# Altium project Ibrahim_Main_Board.PrjPcb (part 2 of 2)

## Sheet MCU_Power_Sheet.SchDoc
size A4; DocumentNumber: 3; SheetNumber: 3; SheetTotal: 7
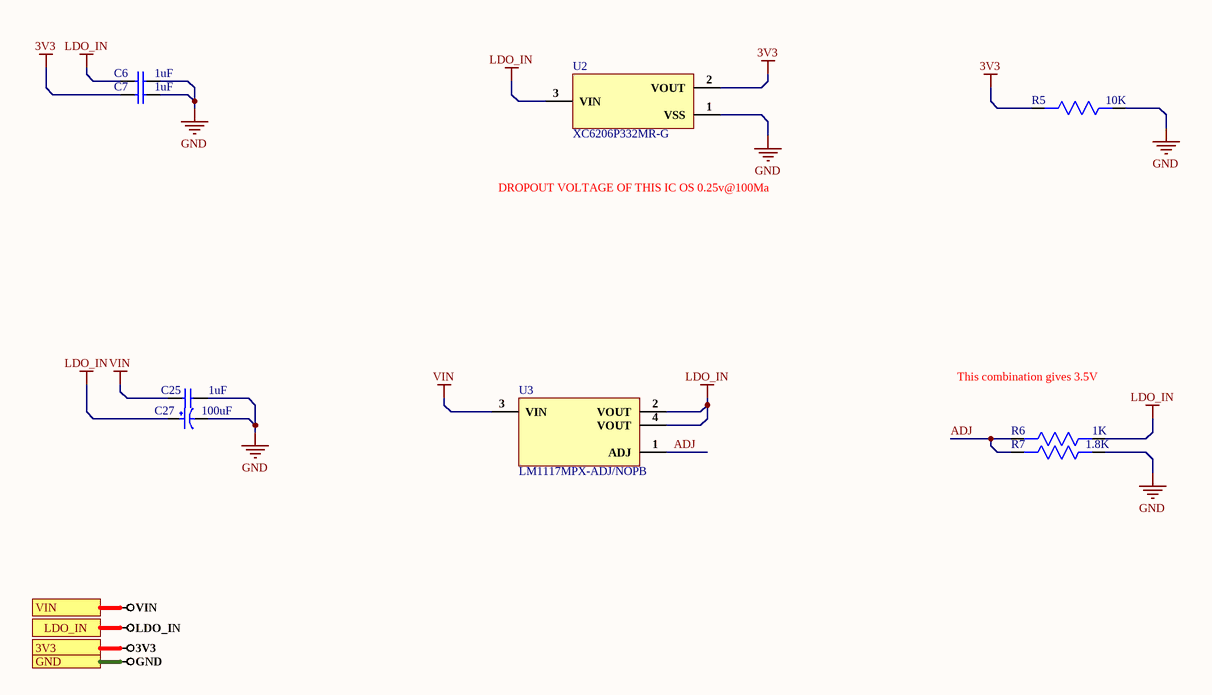
[diagram p5: MCU_Power_Sheet.SchDoc]

### Parts
C6  1uF  [Cap0603]
C7  1uF  [Cap0603]
C25  1uF  [Cap0603]
C27  100uF  [RVT1A101M0505]
R5  10K  [RES 0805]
R6  1K  [RES 0805]
R7  1.8K  [Res0603]
U2  XC6206P332MR-G  [sot-23]
U3  LM1117MPX-ADJ/NOPB  [SOT-223]

### Ports
3V3, GND, LDO_IN, VIN

### Nets
3V3: C7.1 R5.2 U2.2(VOUT) ; port 3V3
GND: C6.2 C7.2 C25.2 C27.2 R5.1 R7.1 U2.1(VSS) ; port GND
LDO_IN: C6.1 C27.1 R6.1 U2.3(VIN) U3.2(VOUT) U3.4(VOUT) ; port LDO_IN
VIN: C25.1 U3.3(VIN) ; port VIN
ADJ: R6.2 R7.2 U3.1(ADJ)

### Notes on the sheet
- DROPOUT VOLTAGE OF THIS IC OS 0.25v@100Ma
- This combination gives 3.5V

### Library data of the parts
C6 C7 C25 = CC0603KRX5R8BB105: CAP CER 1UF 25V X5R 0603; Manufacturer: Yageo; Tolerance: 10%; Supplier 1: Digi-Key; Manufacturer Part Number: CC0603KRX5R8BB105; RoHS: Yes; Category: Ceramic Capacitors; Stock 1: 919939; Pricing 1: 1=0.12000, 10=0.08400, 50=0.04760, 100=0.03940, 500=0.02764, 1000=0.02288 (USD); Mount: Surface Mount; Case/Package: 0603; Number of Pins: 2; Case Code (Metric): 1608; Case Code (Imperial): 0603; Min Operating Temperature: -55°C; Max Operating Temperature: 85°C; Capacitance: 1uF; Dielectric: X5R; Package Quantity: 1; Voltage Rating: 25V; Packaging: Tape and Reel; Termination: SMD/SMT; Voltage Rating (DC): 25V; Series: CC; Construction: Flat; Length: 1.6mm; Width: 0.031inch; Height: 0.8mm; Thickness: 0.035inch; Depth: 0.8mm; Radiation Hardening: No; REACH SVHC: No SVHC; Lead Free: Lead Free; Halogen Free: Halogen Free; RoHS Compliant: Yes; ComponentLink1URL: https://datasheet.ciiva.com/176/mlccorderingcode-176785.pdf?src-supplier=Digi-Key; ComponentLink1Description: https://datasheet.ciiva.com/176/mlccorderingcode-176785.pdf?src-supplier=Digi-Key; ComponentLink2URL: https://datasheet.ciiva.com/176/mlccorderingcode-176786.pdf?src-supplier=Digi-Key; ComponentLink2Description: https://datasheet.ciiva.com/176/mlccorderingcode-176786.pdf?src-supplier=Digi-Key; ComponentLink3URL: https://datasheet.ciiva.com/176/mlccorderingcode-176787.pdf?src-supplier=Digi-Key; ComponentLink3Description: https://datasheet.ciiva.com/176/mlccorderingcode-176787.pdf?src-supplier=Digi-Key; ComponentLink4URL: https://datasheet.ciiva.com/17436/upy-gphc-x5r-4v-to-50v-12-17436952.pdf?src-supplier=Avnet+Europe; ComponentLink4Description: https://datasheet.ciiva.com/17436/upy-gphc-x5r-4v-to-50v-12-17436952.pdf?src-supplier=Avnet+Europe; ComponentLink5URL: https://datasheet.ciiva.com/7978/1525783-7978171.pdf?src-supplier=Element14; ComponentLink5Description: https://datasheet.ciiva.com/7978/1525783-7978171.pdf?src-supplier=Element14; ComponentLink6URL: https://datasheet.ciiva.com/11586/upy-gphc-x5r-4v-to-50v-12-11586318.pdf?src-supplier=Avnet; ComponentLink6Description: https://datasheet.ciiva.com/11586/upy-gphc-x5r-4v-to-50v-12-11586318.pdf?src-supplier=Avnet; Supplier Part Number 1: 311-1445-1-ND
C27 = RVT1A101M0505: 100uF ±20% 10V 5mm 5.4mm 2000hrs 105℃ -45℃~+105℃ SMD,5x5.4mm Aluminum Electrolytic Capacitors - SMD RoHS; Manufacturer: CX(Dongguan Chengxing Elec); Package: SMD,5x5.4mm; Capacitance: 100uF; Tolerance: ±20%; Rated Voltage: 10V; φD: 5mm; L: 5.4mm; Operating Temperature: -45℃~+105℃
R5 = RMCF0805FT10K0: RES 10K OHM 1% 1/8W 0805; Manufacturer: Stackpole Electronics; Resistance: 10kR; Power Rating: 125mW; Temperature Coefficient: 100ppm/°C; Supplier 1: Digi-Key; Manufacturer Part Number: RMCF0805FT10K0; RoHS: Yes; Category: Chip SMD Resistors; Stock 1: 308321; Pricing 1: 1=0.10000, 10=0.02700, 100=0.01090, 1000=0.00488, 2500=0.00423 (USD); Mount: Surface Mount; Case/Package: 0805; Case Code (Metric): 2012; Case Code (Imperial): 0805; Contact Plating: Tin,Matte; Size Code: 0805; Min Operating Temperature: -55°C; Max Operating Temperature: 155°C; Tolerance: 1%; Packaging: Tape and Reel; Resistor Type: Thick Film; Number of Terminations: 2; Max Power Dissipation: 125mW; Features: Automotive AEC-Q200; Series: RMCF; Construction: Rectangular; Length: 2mm; Width: 0.049inch; Height: 0.026inch; Depth: 1.25mm; Radiation Hardening: No; Lead Free: Lead Free; Military Standard: Not; RoHS Compliant: Yes; ComponentLink1URL: https://datasheet.ciiva.com/15193/getdatasheetpartid-362046-15193525.pdf?src-supplier=Verical; ComponentLink1Description: https://datasheet.ciiva.com/15193/getdatasheetpartid-362046-15193525.pdf?src-supplier=Verical; Supplier Part Number 1: RMCF0805FT10K0CT-ND
R6 = CRCW08051K00JNEB: RES SMD 1K OHM 5% 1/8W 0805; Manufacturer: Vishay Dale; Resistance: 1kR; Power Rating: 125mW; Voltage Rating: 150V; Temperature Coefficient: 200ppm/°C; Supplier 1: Digi-Key; Manufacturer Part Number: CRCW08051K00JNEB; RoHS: Yes; Category: Chip SMD Resistors; Stock 1: 4389; Pricing 1: 1=0.10000, 10=0.05000, 100=0.02040, 1000=0.00914, 2500=0.00794, 5000=0.00656 (USD); Case/Package: 0805; Number of Pins: 2; Weight: 0.000194oz; Case Code (Imperial): 0805; Case Code (Metric): 2012; Contact Plating: Tin; Min Operating Temperature: -55°C; Max Operating Temperature: 155°C; Packaging: Tape and Reel; Tolerance: 5%; Package Quantity: 10000; Resistor Type: Thick Film; Number of Terminations: 2; Termination: SMD/SMT; Max Power Dissipation: 125mW; Voltage Rating (DC): 150V; Features: Automotive AEC-Q200; Length: 0.079inch; Width: 0.049inch; Height: 0.02inch; Radiation Hardening: No; REACH SVHC: Unknown; Lead Free: Lead Free; ComponentLink1URL: https://datasheet.ciiva.com/5548/dcrcwe3-109170-5548326.pdf?src-supplier=Mouser; ComponentLink1Description: https://datasheet.ciiva.com/5548/dcrcwe3-109170-5548326.pdf?src-supplier=Mouser; ComponentLink2URL: https://datasheet.ciiva.com/28621/1747939-28621434.pdf?src-supplier=Element14; ComponentLink2Description: https://datasheet.ciiva.com/28621/1747939-28621434.pdf?src-supplier=Element14; Supplier Part Number 1: 541-CRCW08051K00JNEBCT-ND
R7 = RC0603FR-071K8L: Res Thick Film 0603 1.8K Ohm 1% 0.1W(1/10W) ±100ppm/C Molded SMD Paper T/R; Manufacturer: Yageo; Resistance: 1.8kR; Temperature Coefficient: 100ppm/°C; Voltage Rating (DC): 50V; Power Rating: 100mW; Supplier 1: Digi-Key; Manufacturer Part Number: RC0603FR-071K8L; RoHS: Yes; Category: Chip SMD Resistors; Stock 1: 827154; Pricing 1: 1=0.10000, 10=0.02400, 100=0.00970, 1000=0.00436, 2500=0.00378 (USD); Case/Package: 0603; Number of Pins: 2; Case Code (Metric): 1608; Case Code (Imperial): 0603; Size Code: 0603; Min Operating Temperature: -55°C; Max Operating Temperature: 155°C; Tolerance: 1%; Resistor Type: Thick Film; Packaging: Tape and Reel; Voltage Rating: 50V; Package Quantity: 5000; Number of Terminations: 2; Termination: SMD/SMT; Max Power Dissipation: 100mW; Features: Moisture Resistant; Series: RC; Resistance Tolerance: 1%; Technology: THICK FILM; Construction: Rectangular; Length: 1.6mm; Width: 0.8mm; Height: 0.45mm; Depth: 0.8mm; REACH SVHC: No SVHC; Lead Free: Lead Free; Military Standard: Not; RoHS Compliant: Yes; ComponentLink1URL: https://datasheet.ciiva.com/11808/0900766b80f96399-11808105.pdf?src-supplier=RSComponents; ComponentLink1Description: https://datasheet.ciiva.com/11808/0900766b80f96399-11808105.pdf?src-supplier=RSComponents; ComponentLink2URL: https://datasheet.ciiva.com/2519/pyu-r-int-thick-7-2519189.pdf?src-supplier=Digi-Key; ComponentLink2Description: https://datasheet.ciiva.com/2519/pyu-r-int-thick-7-2519189.pdf?src-supplier=Digi-Key; ComponentLink3URL: https://datasheet.ciiva.com/7746/443971-7746277.pdf?src-supplier=Element14; ComponentLink3Description: https://datasheet.ciiva.com/7746/443971-7746277.pdf?src-supplier=Element14; ComponentLink4URL: https://datasheet.ciiva.com/2519/pyu-r-int-thick-7-2519190.pdf?src-supplier=Digi-Key; ComponentLink4Description: https://datasheet.ciiva.com/2519/pyu-r-int-thick-7-2519190.pdf?src-supplier=Digi-Key; ComponentLink5URL: https://datasheet.ciiva.com/7746/443971-7746278.pdf?src-supplier=Element14; ComponentLink5Description: https://datasheet.ciiva.com/7746/443971-7746278.pdf?src-supplier=Element14; ComponentLink6URL: https://datasheet.ciiva.com/12558/rc0603-272842-12558694.pdf?src-supplier=Mouser; ComponentLink6Description: https://datasheet.ciiva.com/12558/rc0603-272842-12558694.pdf?src-supplier=Mouser; ComponentLink7URL: https://datasheet.ciiva.com/2519/pyu-r-int-thick-7-2519191.pdf?src-supplier=Digi-Key; ComponentLink7Description: https://datasheet.ciiva.com/2519/pyu-r-int-thick-7-2519191.pdf?src-supplier=Digi-Key; Supplier Part Number 1: 311-1.80KHRCT-ND
U2 = XC6206P332MR-G: IC REG LINEAR 3.3V 200MA SOT23; Manufacturer: Torex; Output Type: Fixed; Output Configuration: Positive; Number of Regulators: 1; Max Input Voltage: 6V; Dropout Voltage: 680mV; Quiescent Current: 3uA; Supplier 1: Avnet; Manufacturer Part Number: XC6206P332MR-G; RoHS: Yes; Category: Voltage Regulators - Linear; Pricing 1: 3000=0.23146, 6000=0.22820, 12000=0.22168, 18000=0.21679, 24000=0.20864, 30000=0.20375, 300000=0.19886 (USD); Mount: Surface Mount; Case/Package: TO-236-3; Min Operating Temperature: -40°C; Max Operating Temperature: 85°C; Min Output Voltage: 3.3V; Output Current: 200mA; Max Supply Current: 3uA; RoHS Compliant: Yes; ComponentLink1URL: https://www.torexsemi.com/file/xc6206/XC6206.pdf?src-supplier=Digi-Key; ComponentLink1Description: https://www.torexsemi.com/file/xc6206/XC6206.pdf?src-supplier=Digi-Key; Supplier Part Number 1: XC6206P332MR-G
U3 = LM1117MPX-ADJ/NOPB: PMIC - LDO voltage regulator Texas Instruments LM1117MPX-ADJ/NOPB Positivbe, adjustable SOT 223; Manufacturer: TI National Semiconductor; Max Input Voltage: 15V; Output Voltage: 13.8V; Number of Outputs: 1; Max Output Current: 800mA; Reference Voltage: 1.262V; Polarity: Positive; Accuracy: 1%; Dropout Voltage: 1.2V; Min Input Voltage: 2.6V; Min Output Voltage: 1.25V; Quiescent Current: 5mA; Max Supply Current: 10mA; Power Supply Rejection Ratio (PSRR): 75dB; Supplier 1: Mouser; Manufacturer Part Number: LM1117MPX-ADJ/NOPB; RoHS: Yes; Category: Voltage Regulators - Linear; Stock 1: 273; Pricing 1: 1=1.28000, 10=1.15000, 50=1.09000, 100=0.89500, 1000=0.58400, 10000=0.53200 (USD); Mount: Surface Mount; Case/Package: SOT-223; Number of Pins: 4; Contact Plating: Tin,Matte; Min Operating Temperature: 0°C; Max Operating Temperature: 125°C; Output Type: Adjustable; Current Rating: 800mA; Packaging: Tape and Reel; Package Quantity: 2000; Output Current: 800mA; Number of Regulators: 1; Min Current Limit: 800mA; Max Output Voltage: 13.8V; Output Voltage Accuracy: 1%; Series: -; Output Configuration: Positive; Radiation Hardening: No; REACH SVHC: No SVHC; Lead Free: Lead Free; ComponentLink1URL: https://datasheet.ciiva.com/15111/getdatasheetpartid-55626-15111244.pdf?src-supplier=Verical; ComponentLink1Description: https://datasheet.ciiva.com/15111/getdatasheetpartid-55626-15111244.pdf?src-supplier=Verical; ComponentLink2URL: https://datasheet.ciiva.com/3223/lm1117-n-3223530.pdf?src-supplier=Avnet; ComponentLink2Description: https://datasheet.ciiva.com/3223/lm1117-n-3223530.pdf?src-supplier=Avnet; ComponentLink3URL: https://datasheet.ciiva.com/3223/lm1117-n-3223531.pdf?src-supplier=Avnet; ComponentLink3Description: https://datasheet.ciiva.com/3223/lm1117-n-3223531.pdf?src-supplier=Avnet; ComponentLink4URL: https://datasheet.ciiva.com/6596/lm1117-n-6596777.pdf?src-supplier=Digi-Key; ComponentLink4Description: https://datasheet.ciiva.com/6596/lm1117-n-6596777.pdf?src-supplier=Digi-Key; ComponentLink5URL: https://datasheet.ciiva.com/6596/lm1117-n-6596778.pdf?src-supplier=Digi-Key; ComponentLink5Description: https://datasheet.ciiva.com/6596/lm1117-n-6596778.pdf?src-supplier=Digi-Key; ComponentLink6URL: https://datasheet.ciiva.com/6596/lm1117-n-6596779.pdf?src-supplier=Digi-Key; ComponentLink6Description: https://datasheet.ciiva.com/6596/lm1117-n-6596779.pdf?src-supplier=Digi-Key; ComponentLink7URL: https://datasheet.ciiva.com/25980/lm1117-n-25980333.pdf?src-supplier=Avnet+Europe; ComponentLink7Description: https://datasheet.ciiva.com/25980/lm1117-n-25980333.pdf?src-supplier=Avnet+Europe; ComponentLink8URL: https://datasheet.ciiva.com/22710/lm1117-n-22710935.pdf?src-supplier=Element14; ComponentLink8Description: https://datasheet.ciiva.com/22710/lm1117-n-22710935.pdf?src-supplier=Element14; Supplier Part Number 1: 926-LM1117MPXADJNOPB

## Sheet LED_Power_Sheet.SchDoc
size A4; DocumentNumber: 4; SheetNumber: 4; SheetTotal: 7
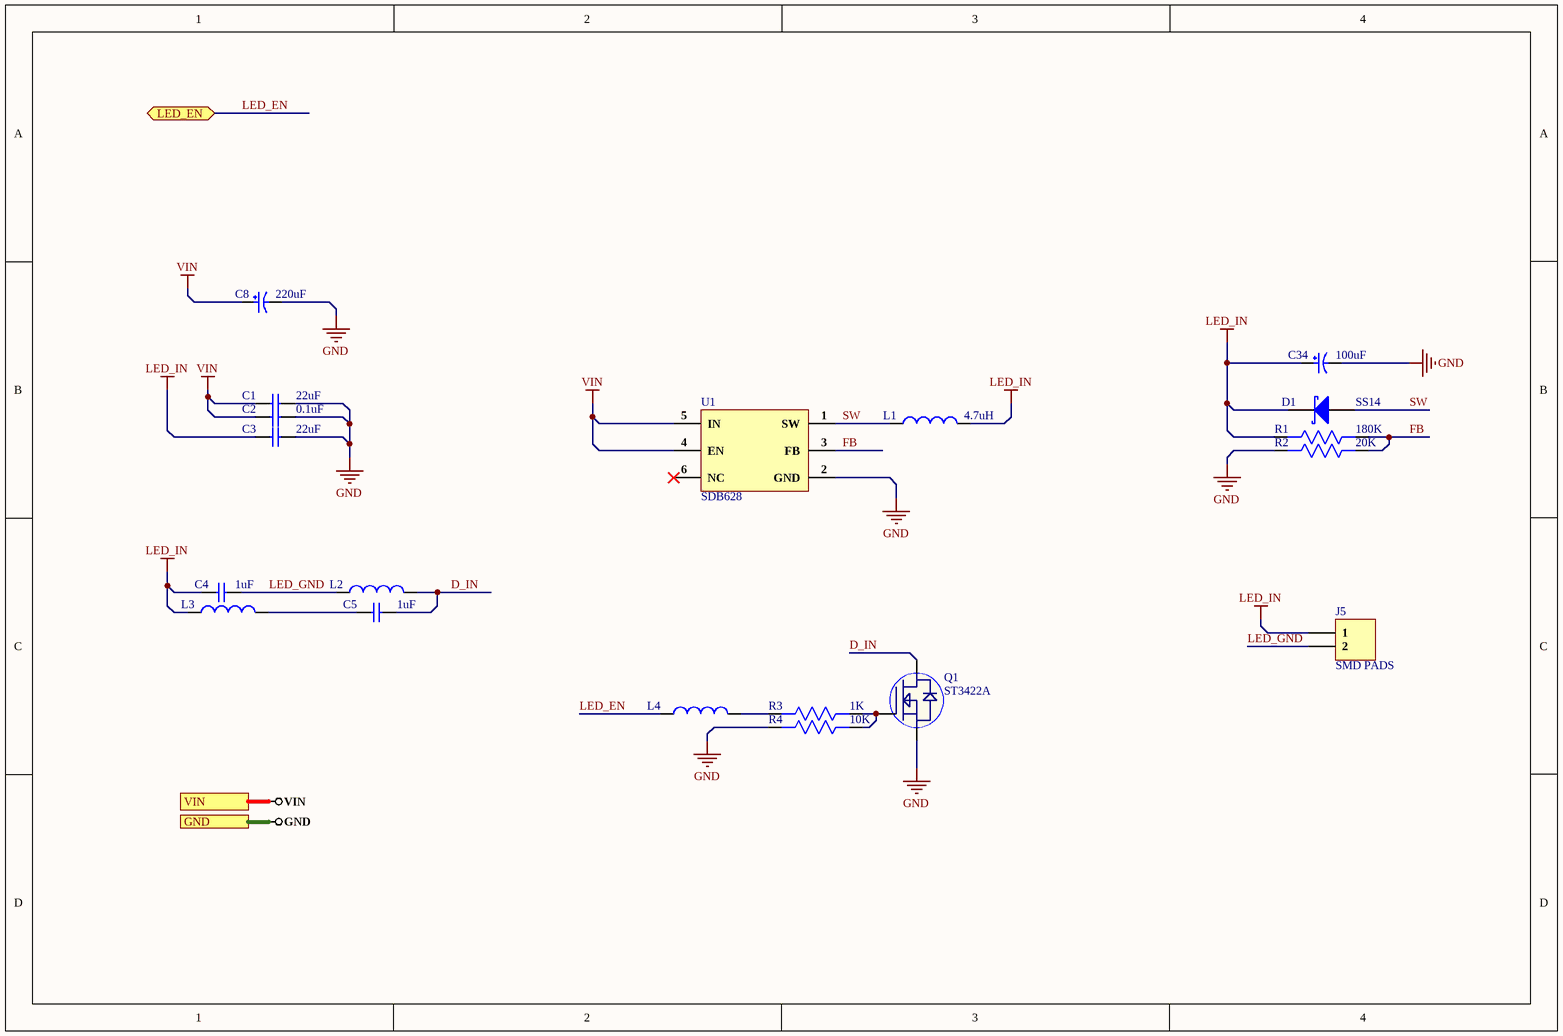
[diagram p6: LED_Power_Sheet.SchDoc]

### Parts
C1  22uF  [Cap0805]
C2  0.1uF  [Cap0805]
C3  22uF  [Cap0805]
C4  1uF  [Cap0603]
C5  1uF  [Cap0603]
C8  220uF  [RVT1C221M0607]
C34  100uF  [RVT1A101M0505]
D1  SS14  [DO-214AC]
J5  SMD PADS  [SMD PAD]
L1  4.7uH  [CD54-4R7M]
L2  BLM21PG121SN1D  [BLM21PG121SN1D]  (value not drawn)
L3  BLM21PG121SN1D  [BLM21PG121SN1D]  (value not drawn)
L4  BLM18AG121SN1D  [BLM18AG121SN1D]  (value not drawn)
Q1  ST3422A  [SOT23-3]
R1  180K  [Res-0201]
R2  20K  [Res-0201]
R3  1K  [RES 0805]
R4  10K  [RES 0805]
U1  SDB628  [SOT-23-6]

### Ports
GND, LED_EN (bidir), VIN

### Nets
GND: C1.2 C2.2 C3.2 C8.2 C34.2 Q1.2(S) R2.2 R4.2 U1.2(GND) ; port GND
LED_IN: C3.1 C4.1 C34.1 D1.2(K) J5.1 L1.2 L3.1 R1.2
VIN: C1.1 C2.1 C8.1 U1.4(EN) U1.5(IN) ; port VIN
D_IN: C5.2 L2.2 Q1.3(D)
FB: R1.1 R2.1 U1.3(FB)
LED_EN: L4.1 ; port LED_EN
LED_GND: C4.2 J5.2 L2.1
SW: D1.1(A) L1.1 U1.1(SW)
NetC5_1: C5.1 L3.2
NetL4_2: L4.2 R3.2
NetQ1_1: Q1.1(G) R3.1 R4.1

Not connected (* = marked no-connect by the designer): U1 6(NC)*

### Library data of the parts
C1 C3 = CL21A226MOQNNNE: CAP CER 22UF 16V X5R 0805; Manufacturer: Samsung; Tolerance: 20%; Supplier 1: Digi-Key; Manufacturer Part Number: CL21A226MOQNNNE; RoHS: Yes; Category: Ceramic Capacitors; Stock 1: 91301; Pricing 1: 1=0.30000, 10=0.20900, 50=0.13900, 100=0.11820, 500=0.08344, 1000=0.07301 (USD); Mount: Surface Mount; Case/Package: 0805; Case Code (Metric): 2012; Case Code (Imperial): 0805; Contact Plating: Tin; Min Operating Temperature: -55°C; Max Operating Temperature: 85°C; Package Quantity: 1; Packaging: Cut Tape; Capacitance: 22uF; Voltage Rating: 16V; Dielectric: X5R; Voltage Rating (DC): 16V; Termination: Wraparound; Series: CL; Construction: Flat; Length: 0.079inch; Width: 0.049inch; Thickness: 0.055inch; RoHS Compliant: Yes; Lead Free: Lead Free; ComponentLink1URL: https://datasheet.ciiva.com/25724/cl21a226moqnnne-25724832.pdf?src-supplier=Digi-Key; ComponentLink1Description: https://datasheet.ciiva.com/25724/cl21a226moqnnne-25724832.pdf?src-supplier=Digi-Key; Supplier Part Number 1: 1276-2909-1-ND
C2 = 0805B104K500CT: CAP CER 0.1UF 50V X7R 0805; Manufacturer: Walsin Technologies; Tolerance: 10%; Capacitance: 100nF; Supplier 1: Digi-Key; Manufacturer Part Number: 0805B104K500CT; RoHS: Yes; Category: Ceramic Capacitors; Stock 1: 1274242; Pricing 1: 1=0.12000, 10=0.08600, 50=0.04900, 100=0.04050, 500=0.02842, 1000=0.02352 (USD); Case/Package: 0805; Case Code (Imperial): 0805; Case Code (Metric): 2012; Min Operating Temperature: -55°C; Max Operating Temperature: 125°C; Packaging: Tape and Reel; Voltage Rating: 50V; Dielectric: X7R; Voltage Rating (DC): 50V; Voltage: 50V; Length: 2mm; Depth: 1.25mm; Radiation Hardening: No; REACH SVHC: Unknown; Lead Free: Lead Free; ComponentLink1URL: http://www.farnell.com/datasheets/2340522.pdf?src-supplier=Farnell; ComponentLink1Description: http://www.farnell.com/datasheets/2340522.pdf?src-supplier=Farnell; ComponentLink2URL: http://components.arrow.com/part/dataview/0323_00650840?src-supplier=Arrow+Europe; ComponentLink2Description: http://components.arrow.com/part/dataview/0323_00650840?src-supplier=Arrow+Europe; ComponentLink3URL: https://www.verical.com/server-webapp/html/getDatasheet?partID=414849&src-supplier=Verical; ComponentLink3Description: https://www.verical.com/server-webapp/html/getDatasheet?partID=414849&src-supplier=Verical; ComponentLink4URL: http://www.farnell.com/datasheets/2340522.pdf?src-supplier=Element14; ComponentLink4Description: http://www.farnell.com/datasheets/2340522.pdf?src-supplier=Element14; ComponentLink5URL: http://www.passivecomponent.com/wp-content/uploads/2018/10/MLCC.pdf?src-supplier=Digi-Key; ComponentLink5Description: http://www.passivecomponent.com/wp-content/uploads/2018/10/MLCC.pdf?src-supplier=Digi-Key; ComponentLink6URL: http://www.passivecomponent.com/indexsea/0805B104K500CT-IB.pdf?src-supplier=Digi-Key; ComponentLink6Description: http://www.passivecomponent.com/indexsea/0805B104K500CT-IB.pdf?src-supplier=Digi-Key; ComponentLink7URL: http://www.farnell.com/datasheets/2340522.pdf?src-supplier=Newark; ComponentLink7Description: http://www.farnell.com/datasheets/2340522.pdf?src-supplier=Newark; Supplier Part Number 1: 1292-1647-1-ND
C4 C5 = CC0603KRX5R8BB105: as C6 on sheet MCU_Power_Sheet; Supplier 1: Digi-Key; Manufacturer Part Number: CC0603KRX5R8BB105; RoHS: Yes; Category: Ceramic Capacitors; Stock 1: 919939; Pricing 1: 1=0.12000, 10=0.08400, 50=0.04760, 100=0.03940, 500=0.02764, 1000=0.02288 (USD); Mount: Surface Mount; Case/Package: 0603; Number of Pins: 2; Case Code (Metric): 1608; Case Code (Imperial): 0603; Min Operating Temperature: -55°C; Max Operating Temperature: 85°C; Capacitance: 1uF; Dielectric: X5R; Package Quantity: 1; Voltage Rating: 25V; Packaging: Tape and Reel; Termination: SMD/SMT; Voltage Rating (DC): 25V; Series: CC; Construction: Flat; Length: 1.6mm; Width: 0.031inch; Height: 0.8mm; Thickness: 0.035inch; Depth: 0.8mm; Radiation Hardening: No; REACH SVHC: No SVHC; Lead Free: Lead Free; Halogen Free: Halogen Free; RoHS Compliant: Yes; ComponentLink1URL: https://datasheet.ciiva.com/176/mlccorderingcode-176785.pdf?src-supplier=Digi-Key; ComponentLink1Description: https://datasheet.ciiva.com/176/mlccorderingcode-176785.pdf?src-supplier=Digi-Key; ComponentLink2URL: https://datasheet.ciiva.com/176/mlccorderingcode-176786.pdf?src-supplier=Digi-Key; ComponentLink2Description: https://datasheet.ciiva.com/176/mlccorderingcode-176786.pdf?src-supplier=Digi-Key; ComponentLink3URL: https://datasheet.ciiva.com/176/mlccorderingcode-176787.pdf?src-supplier=Digi-Key; ComponentLink3Description: https://datasheet.ciiva.com/176/mlccorderingcode-176787.pdf?src-supplier=Digi-Key; ComponentLink4URL: https://datasheet.ciiva.com/17436/upy-gphc-x5r-4v-to-50v-12-17436952.pdf?src-supplier=Avnet+Europe; ComponentLink4Description: https://datasheet.ciiva.com/17436/upy-gphc-x5r-4v-to-50v-12-17436952.pdf?src-supplier=Avnet+Europe; ComponentLink5URL: https://datasheet.ciiva.com/7978/1525783-7978171.pdf?src-supplier=Element14; ComponentLink5Description: https://datasheet.ciiva.com/7978/1525783-7978171.pdf?src-supplier=Element14; ComponentLink6URL: https://datasheet.ciiva.com/11586/upy-gphc-x5r-4v-to-50v-12-11586318.pdf?src-supplier=Avnet; ComponentLink6Description: https://datasheet.ciiva.com/11586/upy-gphc-x5r-4v-to-50v-12-11586318.pdf?src-supplier=Avnet; Supplier Part Number 1: 311-1445-1-ND
C8 = RVT1C221M0607: 220uF 16V 6.3mm 7.7mm 2000hrs 105℃ -55℃~+105℃ SMD,6.3x7.7mm Aluminum Electrolytic Capacitors - SMD RoHS; Manufacturer: Honor Elec; Value: Custom; Manufacturer Part No: RVT1C221M0607; Package: Custom; ComponentLink1Description: Supplier Link; ComponentLink1URL: https://lcsc.com/product-detail/Aluminum-Electrolytic-Capacitors-SMD_Honor-Elec-RVT1C221M0607_C3342.html
C34 = RVT1A101M0505: as C27 on sheet MCU_Power_Sheet; Package: SMD,5x5.4mm; Capacitance: 100uF; Tolerance: ±20%; Rated Voltage: 10V; φD: 5mm; L: 5.4mm; Operating Temperature: -45℃~+105℃
D1 = SS14: DIODE SCHOTTKY 40V 1A SMA; Manufacturer: ON Semiconductor / Fairchild; Number of Terminals/Pins: 2; Element Configuration: Single; Forward Voltage: 500mV; Max Forward Surge Current (Ifsm): 40A; Max Reverse Current: 200uA; Polarity: Standard; Max Power Dissipation: 1.1W; Number of Elements: 1; Supplier 1: Future Electronics; Manufacturer Part Number: SS14; RoHS: Yes; Category: Schottky Diodes; Stock 1: 52500; Pricing 1: 7500=0.18400, 15000=0.14900, 22500=0.14800, 30000=0.14700 (USD); Mount: Surface Mount; Case/Package: DO-214AC; Number of Pins: 2; Weight: 0.003739oz; Min Operating Temperature: -65°C; Max Operating Temperature: 125°C; Packaging: Tape and Reel; Max Repetitive Reverse Voltage (Vrrm): 40V; Package Quantity: 7500; Forward Current: 1A; Current Rating: 1A; Peak Non-Repetitive Surge Current: 40A; Termination: SMD/SMT; Voltage Rating (DC): 40V; Average Rectified Current: 1A; Max Reverse Voltage (DC): 40V; Series: -; Output Current: 1A; Current: 1A; Voltage: 40V; Power Dissipation: 1.1W; Length: 4.75mm; Width: 2.95mm; Height: 2.2mm; Radiation Hardening: No; RoHS Compliant: Yes; Lead Free: Lead Free; REACH SVHC: No SVHC; Supplier Part Number 1: 5716527
J5 = SMD PAD
L1 = CD54-4R7M: SMD Power Inductors RoHS; Manufacturer: DMBJ; Value: Custom; Manufacturer Part No: CD54-4R7M; Package: Custom; ComponentLink1Description: Supplier Link; ComponentLink1URL: https://lcsc.com/product-detail/Power-Inductors_DMBJ-CD54-4R7M_C2826660.html
L2 L3 = BLM21PG121SN1D: Ferrite Bead 120 ohm, 3 A, 0805; Manufacturer: Murata; Material: Steel,Ferrite; Impedance: 120R; Current Rating: 3A; DC Resistance (DCR): 30mR; Number of Lines: 1; Tolerance: 25%; Test Frequency: 100MHz; ComponentLink1URL: https://datasheet.ciiva.com/1012/l0110s0100blm18p-1012160.pdf?src-supplier=Digi-Key; ComponentLink1Description: https://datasheet.ciiva.com/1012/l0110s0100blm18p-1012160.pdf?src-supplier=Digi-Key; ComponentLink2URL: https://datasheet.ciiva.com/8021/5148-8021488.pdf?src-supplier=Element14; ComponentLink2Description: https://datasheet.ciiva.com/8021/5148-8021488.pdf?src-supplier=Element14; ComponentLink3URL: https://datasheet.ciiva.com/11799/0900766b81275ca5-11799524.pdf?src-supplier=RSComponents; ComponentLink3Description: https://datasheet.ciiva.com/11799/0900766b81275ca5-11799524.pdf?src-supplier=RSComponents; ComponentLink4URL: https://datasheet.ciiva.com/19458/1845056-19458409.pdf?src-supplier=Jameco; ComponentLink4Description: https://datasheet.ciiva.com/19458/1845056-19458409.pdf?src-supplier=Jameco; ComponentLink5URL: https://datasheet.ciiva.com/3081/l0110s0100blm18p-3081637.pdf?src-supplier=Avnet; ComponentLink5Description: https://datasheet.ciiva.com/3081/l0110s0100blm18p-3081637.pdf?src-supplier=Avnet; ComponentLink6URL: https://datasheet.ciiva.com/16420/l0110s0100blm18p-16420745.pdf?src-supplier=Future+Electronics; ComponentLink6Description: https://datasheet.ciiva.com/16420/l0110s0100blm18p-16420745.pdf?src-supplier=Future+Electronics; ComponentLink7URL: https://datasheet.ciiva.com/1012/l0110s0100blm18p-1012158.pdf?src-supplier=Digi-Key; ComponentLink7Description: https://datasheet.ciiva.com/1012/l0110s0100blm18p-1012158.pdf?src-supplier=Digi-Key; ComponentLink8URL: https://datasheet.ciiva.com/1012/l0110s0100blm18p-1012159.pdf?src-supplier=Digi-Key; ComponentLink8Description: https://datasheet.ciiva.com/1012/l0110s0100blm18p-1012159.pdf?src-supplier=Digi-Key; Supplier 1: Digi-Key; Manufacturer Part Number: BLM21PG121SN1D; RoHS: Yes; Category: Ferrite Beads and Chips; Stock 1: 1370; Pricing 1: 1=0.13000, 10=0.10300, 25=0.09320, 50=0.06820, 100=0.05890, 250=0.04652, 500=0.03930, 1000=0.03309 (USD); Case/Package: 0805; Number of Pins: 2; Case Code (Metric): 2012; Case Code (Imperial): 0805; Min Operating Temperature: -55°C; Max Operating Temperature: 125°C; Packaging: Tape and Reel; Number of Circuits: 1; Package Quantity: 1; Max Current Rating: 3A; Max DC Current: 3A; Termination: SMD/SMT; Series: BLM21P; DC Resistance-Max: 30mR; Length: 2mm; Width: 1.25mm; Height: 0.85mm; Depth: 1.25mm; REACH SVHC: No SVHC; Lead Free: Lead Free; RoHS Compliant: Yes; ComponentLink9URL: https://datasheet.ciiva.com/16420/l0110s0100blm21p-16420725.pdf?src-supplier=Future+Electronics; ComponentLink9Description: https://datasheet.ciiva.com/16420/l0110s0100blm21p-16420725.pdf?src-supplier=Future+Electronics; ComponentLink10URL: https://datasheet.ciiva.com/6211/l0110s0100blm21p-6211734.pdf?src-supplier=Digi-Key; ComponentLink10Description: https://datasheet.ciiva.com/6211/l0110s0100blm21p-6211734.pdf?src-supplier=Digi-Key; ComponentLink11URL: https://datasheet.ciiva.com/6211/l0110s0100blm21p-6211738.pdf?src-supplier=Digi-Key; ComponentLink11Description: https://datasheet.ciiva.com/6211/l0110s0100blm21p-6211738.pdf?src-supplier=Digi-Key; ComponentLink12URL: https://datasheet.ciiva.com/6211/l0110s0100blm21p-6211739.pdf?src-supplier=Digi-Key; ComponentLink12Description: https://datasheet.ciiva.com/6211/l0110s0100blm21p-6211739.pdf?src-supplier=Digi-Key; ComponentLink13URL: https://datasheet.ciiva.com/46423/1756152-46423915.pdf?src-supplier=Element14; ComponentLink13Description: https://datasheet.ciiva.com/46423/1756152-46423915.pdf?src-supplier=Element14; Supplier Part Number 1: 490-5986-1-ND
L4 = BLM18AG121SN1D: Ferrite Beads 120Ohm 25% 500mA 0603; Manufacturer: Murata; Material: Steel,Ferrite; Impedance: 120R; DC Resistance (DCR): 180mR; Test Frequency: 100MHz; Number of Lines: 1; Shielding: Unshielded; Supplier 1: Digi-Key; Manufacturer Part Number: BLM18AG121SN1D; RoHS: Yes; Category: Inductors; Stock 1: 1660; Pricing 1: 1=0.10000, 10=0.07900, 25=0.07200, 50=0.06480, 100=0.04760, 250=0.03460, 500=0.03170, 1000=0.02738 (USD); Case/Package: 0603; Number of Pins: 2; Core Material: Ferrite; Case Code (Metric): 1608; Case Code (Imperial): 0603; Min Operating Temperature: -55°C; Max Operating Temperature: 125°C; Tolerance: 25%; Max DC Current: 500mA; Package Quantity: 1; Max Current Rating: 500mA; Packaging: Tape and Reel; Current Rating: 500mA; Termination: SMD/SMT; DC Current: 500mA; Frequency: 100MHz; Number of Circuits: 1; Series: BLM18A; DC Resistance-Max: 180mR; Length: 1.6mm; Width: 0.8mm; Height: 0.8mm; Depth: 0.8mm; Radiation Hardening: No; REACH SVHC: No SVHC; Military Standard: Not; Lead Free: Lead Free; RoHS Compliant: Yes; ComponentLink1URL: https://datasheet.ciiva.com/11795/0900766b811b5866-11795382.pdf?src-supplier=RSComponents; ComponentLink1Description: https://datasheet.ciiva.com/11795/0900766b811b5866-11795382.pdf?src-supplier=RSComponents; ComponentLink2URL: https://datasheet.ciiva.com/19460/1844723-19460204.pdf?src-supplier=Jameco; ComponentLink2Description: https://datasheet.ciiva.com/19460/1844723-19460204.pdf?src-supplier=Jameco; ComponentLink3URL: https://datasheet.ciiva.com/29347/442268-da-01-en-chip-drossel-0603-120r-500ma-1-6x0-8mm-29347890.pdf?src-supplier=Conrad; ComponentLink3Description: https://datasheet.ciiva.com/29347/442268-da-01-en-chip-drossel-0603-120r-500ma-1-6x0-8mm-29347890.pdf?src-supplier=Conrad; ComponentLink4URL: https://datasheet.ciiva.com/41449/001172222-da-01-en-drossel-0603-120r-1-6x0-8mm-4000st-41449509.pdf?src-supplier=Conrad; ComponentLink4Description: https://datasheet.ciiva.com/41449/001172222-da-01-en-drossel-0603-120r-1-6x0-8mm-4000st-41449509.pdf?src-supplier=Conrad; ComponentLink5URL: https://datasheet.ciiva.com/14122/blm-series-eng-tds-14122902.pdf?src-supplier=Distrelec; ComponentLink5Description: https://datasheet.ciiva.com/14122/blm-series-eng-tds-14122902.pdf?src-supplier=Distrelec; ComponentLink6URL: https://datasheet.ciiva.com/17246/l0110s0100blm18a-17246919.pdf?src-supplier=Avnet+Europe; ComponentLink6Description: https://datasheet.ciiva.com/17246/l0110s0100blm18a-17246919.pdf?src-supplier=Avnet+Europe; ComponentLink7URL: https://datasheet.ciiva.com/3081/l0110s0100blm18a-3081610.pdf?src-supplier=Avnet; ComponentLink7Description: https://datasheet.ciiva.com/3081/l0110s0100blm18a-3081610.pdf?src-supplier=Avnet; ComponentLink8URL: https://datasheet.ciiva.com/1012/l0110s0100blm18a-1012011.pdf?src-supplier=Digi-Key; ComponentLink8Description: https://datasheet.ciiva.com/1012/l0110s0100blm18a-1012011.pdf?src-supplier=Digi-Key; ComponentLink9URL: https://datasheet.ciiva.com/1012/l0110s0100blm18a-1012012.pdf?src-supplier=Digi-Key; ComponentLink9Description: https://datasheet.ciiva.com/1012/l0110s0100blm18a-1012012.pdf?src-supplier=Digi-Key; ComponentLink10URL: https://datasheet.ciiva.com/8510/l0110s0100blm18a-8510156.pdf?src-supplier=Avnet; ComponentLink10Description: https://datasheet.ciiva.com/8510/l0110s0100blm18a-8510156.pdf?src-supplier=Avnet; ComponentLink11URL: https://datasheet.ciiva.com/1012/l0110s0100blm18a-1012013.pdf?src-supplier=Digi-Key; ComponentLink11Description: https://datasheet.ciiva.com/1012/l0110s0100blm18a-1012013.pdf?src-supplier=Digi-Key; ComponentLink12URL: https://datasheet.ciiva.com/16215/l0110s0100blm18a-16215230.pdf?src-supplier=Future+Electronics; ComponentLink12Description: https://datasheet.ciiva.com/16215/l0110s0100blm18a-16215230.pdf?src-supplier=Future+Electronics; Supplier Part Number 1: 490-1011-1-ND
Q1 = ST3422A: SOT-23-3L MOSFETs RoHS; Manufacturer: STANSON Tech.; Value: Custom; Manufacturer Part No: ST3422A; Package: SOT-23-3; ComponentLink1Description: Supplier Link; ComponentLink1URL: https://lcsc.com/product-detail/MOSFETs_STANSON-Tech-ST3422A_C2682907.html
R1 = RC0201FR-07180KL: RES SMD 180K OHM 1% 1/20W 0201; Manufacturer: Yageo; Resistance: 180kR; Power Rating: 50mW; Voltage Rating: 25V; Temperature Coefficient: 200ppm/°C; Supplier 1: Digi-Key; Manufacturer Part Number: RC0201FR-07180KL; RoHS: Yes; Category: Chip SMD Resistors; Stock 1: 75612; Pricing 1: 1=0.10000, 10=0.04200, 100=0.01700, 1000=0.00765, 2500=0.00664, 5000=0.00548 (USD); Case/Package: 0201; Case Code (Imperial): 0201; Case Code (Metric): 0603; Size Code: 0201; Min Operating Temperature: -55°C; Max Operating Temperature: 125°C; Packaging: Tape and Reel; Tolerance: 1%; Resistor Type: Thick Film; Number of Terminations: 2; Termination: SMD/SMT; Max Power Dissipation: 50mW; Features: Moisture Resistant; Series: RC; Resistance Tolerance: 1%; Construction: Rectangular; Length: 0.6mm; Width: 0.012inch; Height: 0.01inch; Depth: 0.3mm; REACH SVHC: Unknown; Military Standard: Not; Lead Free: Lead Free; RoHS Compliant: Yes; ComponentLink1URL: https://datasheet.ciiva.com/22735/1563626-22735431.pdf?src-supplier=Element14; ComponentLink1Description: https://datasheet.ciiva.com/22735/1563626-22735431.pdf?src-supplier=Element14; ComponentLink2URL: https://datasheet.ciiva.com/6001/1563626-6001205.pdf?src-supplier=Farnell; ComponentLink2Description: https://datasheet.ciiva.com/6001/1563626-6001205.pdf?src-supplier=Farnell; ComponentLink3URL: https://datasheet.ciiva.com/22661/1563626-22661289.pdf?src-supplier=Element14; ComponentLink3Description: https://datasheet.ciiva.com/22661/1563626-22661289.pdf?src-supplier=Element14; Supplier Part Number 1: YAG2449CT-ND
R2 = RC0201FR-0720KL: RES SMD 20K OHM 1% 1/20W 0201; Manufacturer: Yageo; Voltage Rating: 25V; Resistance: 20kR; Power Rating: 50mW; Temperature Coefficient: 200ppm/°C; Supplier 1: Avnet; Manufacturer Part Number: RC0201FR-0720KL; RoHS: Yes; Category: Chip SMD Resistors; Stock 1: 60000; Pricing 1: 10000=0.00135, 20000=0.00133, 40000=0.00129, 60000=0.00126, 80000=0.00122, 100000=0.00119, 1000000=0.00116 (USD); Case/Package: 0201; Case Code (Imperial): 0201; Case Code (Metric): 0603; Size Code: 0201; Min Operating Temperature: -55°C; Max Operating Temperature: 125°C; Tolerance: 1%; Packaging: Tape and Reel; Package Quantity: 10000; Resistor Type: Thick Film; Termination: SMD/SMT; Number of Terminations: 2; Max Power Dissipation: 50mW; Features: Moisture Resistant; Series: RC; Construction: Rectangular; Length: 0.024inch; Width: 0.012inch; Height: 0.01inch; Depth: 0.3mm; Military Standard: Not; Lead Free: Lead Free; RoHS Compliant: Yes; ComponentLink1URL: https://datasheet.ciiva.com/14985/pyu-r-int-thick-7-14985446.pdf?src-supplier=Digi-Key; ComponentLink1Description: https://datasheet.ciiva.com/14985/pyu-r-int-thick-7-14985446.pdf?src-supplier=Digi-Key; Supplier Part Number 1: RC0201FR-0720KL
R3 = CRCW08051K00JNEB: as R6 on sheet MCU_Power_Sheet; Supplier 1: Digi-Key; Manufacturer Part Number: CRCW08051K00JNEB; RoHS: Yes; Category: Chip SMD Resistors; Stock 1: 4389; Pricing 1: 1=0.10000, 10=0.05000, 100=0.02040, 1000=0.00914, 2500=0.00794, 5000=0.00656 (USD); Case/Package: 0805; Number of Pins: 2; Weight: 0.000194oz; Case Code (Imperial): 0805; Case Code (Metric): 2012; Contact Plating: Tin; Min Operating Temperature: -55°C; Max Operating Temperature: 155°C; Packaging: Tape and Reel; Tolerance: 5%; Package Quantity: 10000; Resistor Type: Thick Film; Number of Terminations: 2; Termination: SMD/SMT; Max Power Dissipation: 125mW; Voltage Rating (DC): 150V; Features: Automotive AEC-Q200; Length: 0.079inch; Width: 0.049inch; Height: 0.02inch; Radiation Hardening: No; REACH SVHC: Unknown; Lead Free: Lead Free; ComponentLink1URL: https://datasheet.ciiva.com/5548/dcrcwe3-109170-5548326.pdf?src-supplier=Mouser; ComponentLink1Description: https://datasheet.ciiva.com/5548/dcrcwe3-109170-5548326.pdf?src-supplier=Mouser; ComponentLink2URL: https://datasheet.ciiva.com/28621/1747939-28621434.pdf?src-supplier=Element14; ComponentLink2Description: https://datasheet.ciiva.com/28621/1747939-28621434.pdf?src-supplier=Element14; Supplier Part Number 1: 541-CRCW08051K00JNEBCT-ND
R4 = RMCF0805FT10K0: as R5 on sheet MCU_Power_Sheet; Supplier 1: Digi-Key; Manufacturer Part Number: RMCF0805FT10K0; RoHS: Yes; Category: Chip SMD Resistors; Stock 1: 308321; Pricing 1: 1=0.10000, 10=0.02700, 100=0.01090, 1000=0.00488, 2500=0.00423 (USD); Mount: Surface Mount; Case/Package: 0805; Case Code (Metric): 2012; Case Code (Imperial): 0805; Contact Plating: Tin,Matte; Size Code: 0805; Min Operating Temperature: -55°C; Max Operating Temperature: 155°C; Tolerance: 1%; Packaging: Tape and Reel; Resistor Type: Thick Film; Number of Terminations: 2; Max Power Dissipation: 125mW; Features: Automotive AEC-Q200; Series: RMCF; Construction: Rectangular; Length: 2mm; Width: 0.049inch; Height: 0.026inch; Depth: 1.25mm; Radiation Hardening: No; Lead Free: Lead Free; Military Standard: Not; RoHS Compliant: Yes; ComponentLink1URL: https://datasheet.ciiva.com/15193/getdatasheetpartid-362046-15193525.pdf?src-supplier=Verical; ComponentLink1Description: https://datasheet.ciiva.com/15193/getdatasheetpartid-362046-15193525.pdf?src-supplier=Verical; Supplier Part Number 1: RMCF0805FT10K0CT-ND
U1 = SDB628: 24V 2A SOT-23-6 DC-DC Converters RoHS; Manufacturer: SHOUDING; Value: Custom; Manufacturer Part No: SDB628; Package: SOT-23-6; ComponentLink1Description: Supplier link; ComponentLink1URL: https://lcsc.com/product-detail/DC-DC-Converters_SDB628_C77805.html

## Nets that join several sheets
3V3: Connector_Section (J1.8 P1.1), MCU_Power_Sheet (C7.1 R5.2 U2.2)
GND: MCU_Section (25 pins), Connector_Section (8 pins), Amplifier_Section (6 pins), MCU_Power_Sheet (7 pins), LED_Power_Sheet (9 pins)
LDO_IN: MCU_Section (C13.1 C14.1 U4.2), Connector_Section (P4.1), MCU_Power_Sheet (6 pins)
VIN: Connector_Section (C24.1 J3.1 L11.1 P5.1), Amplifier_Section (C33.1 C38.1 U5.1 U5.3), MCU_Power_Sheet (C25.1 U3.3), LED_Power_Sheet (5 pins)
AVD33: MCU_Section (C20.1 C21.1 C29.1 C30.1), Amplifier_Section (C40.1 R11.2)
B_LED: MCU_Section (L8.1), Connector_Section (J1.2)
IN+: MCU_Section (C29.2 U4.46), Amplifier_Section (C36.1)
LED_EN: MCU_Section (U4.30), LED_Power_Sheet (L4.1)
PLAY_KEY: MCU_Section (L6.2), Connector_Section (J1.6)
SW_CLK: MCU_Section (U4.38), Connector_Section (P1.3)
SW_DATA: MCU_Section (U4.39), Connector_Section (P1.4)
T_LED1: MCU_Section (L7.1), Connector_Section (J1.1)
TCH_TX: MCU_Section (L5.1), Connector_Section (L13.1)
TKEY1: MCU_Section (L9.1 R9.2), Connector_Section (J1.3)
TKEY2: MCU_Section (L10.1 R8.2), Connector_Section (J1.5)
USB_DM: MCU_Section (U4.26), Connector_Section (J2.1)
USB_DP: MCU_Section (U4.27), Connector_Section (J2.2)